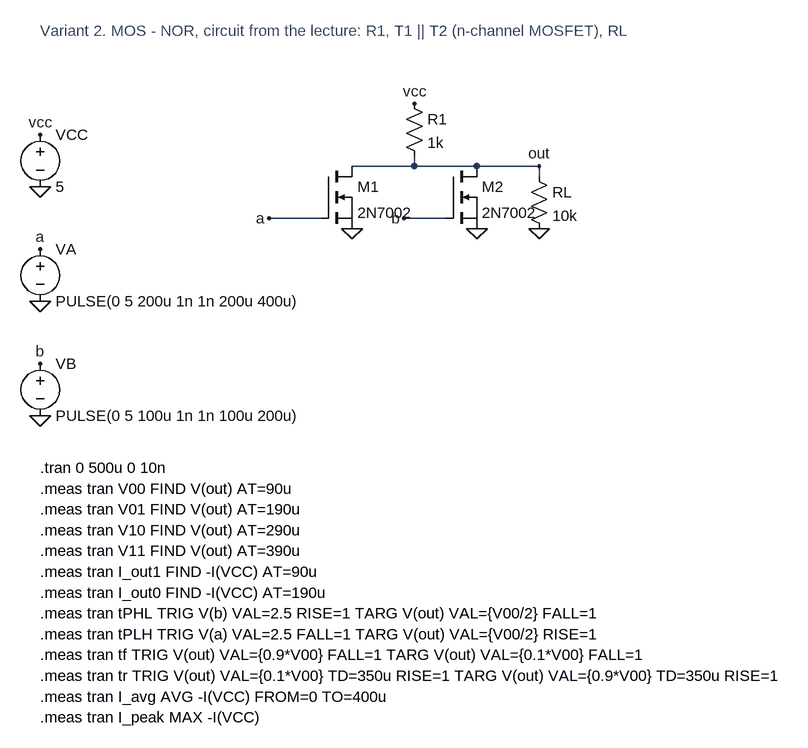
[diagram p0: schematic 4_MOS_NOR.asc]
4_MOS_NOR.asc, the LTspice schematic file:
Version 4
SHEET 1 1400 760
SYMBOL voltage -288 32 R0
SYMATTR InstName VCC
SYMATTR Value 5
FLAG -288 48 vcc
FLAG -288 128 0
SYMBOL voltage -288 208 R0
SYMATTR InstName VA
SYMATTR Value PULSE(0 5 200u 1n 1n 200u 400u)
FLAG -288 224 a
FLAG -288 304 0
SYMBOL voltage -288 384 R0
SYMATTR InstName VB
SYMATTR Value PULSE(0 5 100u 1n 1n 100u 200u)
FLAG -288 400 b
FLAG -288 480 0
SYMBOL nmos 144 96 R0
SYMATTR InstName M1
SYMATTR Value 2N7002
SYMBOL nmos 336 96 R0
SYMATTR InstName M2
SYMATTR Value 2N7002
SYMBOL res 272 -16 R0
SYMATTR InstName R1
SYMATTR Value 1k
FLAG 288 0 vcc
WIRE 288 80 288 96
WIRE 192 96 288 96
WIRE 288 96 384 96
WIRE 384 96 480 96
FLAG 480 96 out
SYMBOL res 464 96 R0
SYMATTR InstName RL
SYMATTR Value 10k
WIRE 480 96 480 112
FLAG 480 192 0
WIRE 144 176 64 176
FLAG 64 176 a
WIRE 336 176 272 176
FLAG 272 176 b
FLAG 192 192 0
FLAG 384 192 0
TEXT -288 -112 Left 2 ;Variant 2. MOS - NOR, circuit from the lecture: R1, T1 || T2 (n-channel MOSFET), RL
TEXT -288 560 Left 2 !.tran 0 500u 0 10n
TEXT -288 592 Left 2 !.meas tran V00 FIND V(out) AT=90u
TEXT -288 624 Left 2 !.meas tran V01 FIND V(out) AT=190u
TEXT -288 656 Left 2 !.meas tran V10 FIND V(out) AT=290u
TEXT -288 688 Left 2 !.meas tran V11 FIND V(out) AT=390u
TEXT -288 720 Left 2 !.meas tran I_out1 FIND -I(VCC) AT=90u
TEXT -288 752 Left 2 !.meas tran I_out0 FIND -I(VCC) AT=190u
TEXT -288 784 Left 2 !.meas tran tPHL TRIG V(b) VAL=2.5 RISE=1 TARG V(out) VAL={V00/2} FALL=1
TEXT -288 816 Left 2 !.meas tran tPLH TRIG V(a) VAL=2.5 FALL=1 TARG V(out) VAL={V00/2} RISE=1
TEXT -288 848 Left 2 !.meas tran tf TRIG V(out) VAL={0.9*V00} FALL=1 TARG V(out) VAL={0.1*V00} FALL=1
TEXT -288 880 Left 2 !.meas tran tr TRIG V(out) VAL={0.1*V00} TD=350u RISE=1 TARG V(out) VAL={0.9*V00} TD=350u RISE=1
TEXT -288 912 Left 2 !.meas tran I_avg AVG -I(VCC) FROM=0 TO=400u
TEXT -288 944 Left 2 !.meas tran I_peak MAX -I(VCC)

The netlist it stands for:
* 4_MOS_NOR.asc
VCC vcc 0 5
VA a 0 PULSE(0 5 200u 1n 1n 200u 400u)
VB b 0 PULSE(0 5 100u 1n 1n 100u 200u)
M1 out a 0 0 2N7002
M2 out b 0 0 2N7002
R1 vcc out 1k
RL out 0 10k
.model NMOS NMOS
.model PMOS PMOS
.lib standard.mos
* Variant 2. MOS - NOR, circuit from the lecture: R1, T1 || T2 (n-channel MOSFET), RL
.tran 0 500u 0 10n
.meas tran V00 FIND V(out) AT=90u
.meas tran V01 FIND V(out) AT=190u
.meas tran V10 FIND V(out) AT=290u
.meas tran V11 FIND V(out) AT=390u
.meas tran I_out1 FIND -I(VCC) AT=90u
.meas tran I_out0 FIND -I(VCC) AT=190u
.meas tran tPHL TRIG V(b) VAL=2.5 RISE=1 TARG V(out) VAL={V00/2} FALL=1
.meas tran tPLH TRIG V(a) VAL=2.5 FALL=1 TARG V(out) VAL={V00/2} RISE=1
.meas tran tf TRIG V(out) VAL={0.9*V00} FALL=1 TARG V(out) VAL={0.1*V00} FALL=1
.meas tran tr TRIG V(out) VAL={0.1*V00} TD=350u RISE=1 TARG V(out) VAL={0.9*V00} TD=350u RISE=1
.meas tran I_avg AVG -I(VCC) FROM=0 TO=400u
.meas tran I_peak MAX -I(VCC)
.backanno
.end